# Altium schematic sheet Buck_Converter.SchDoc
size B; SheetNumber: 4; SheetTotal: 4
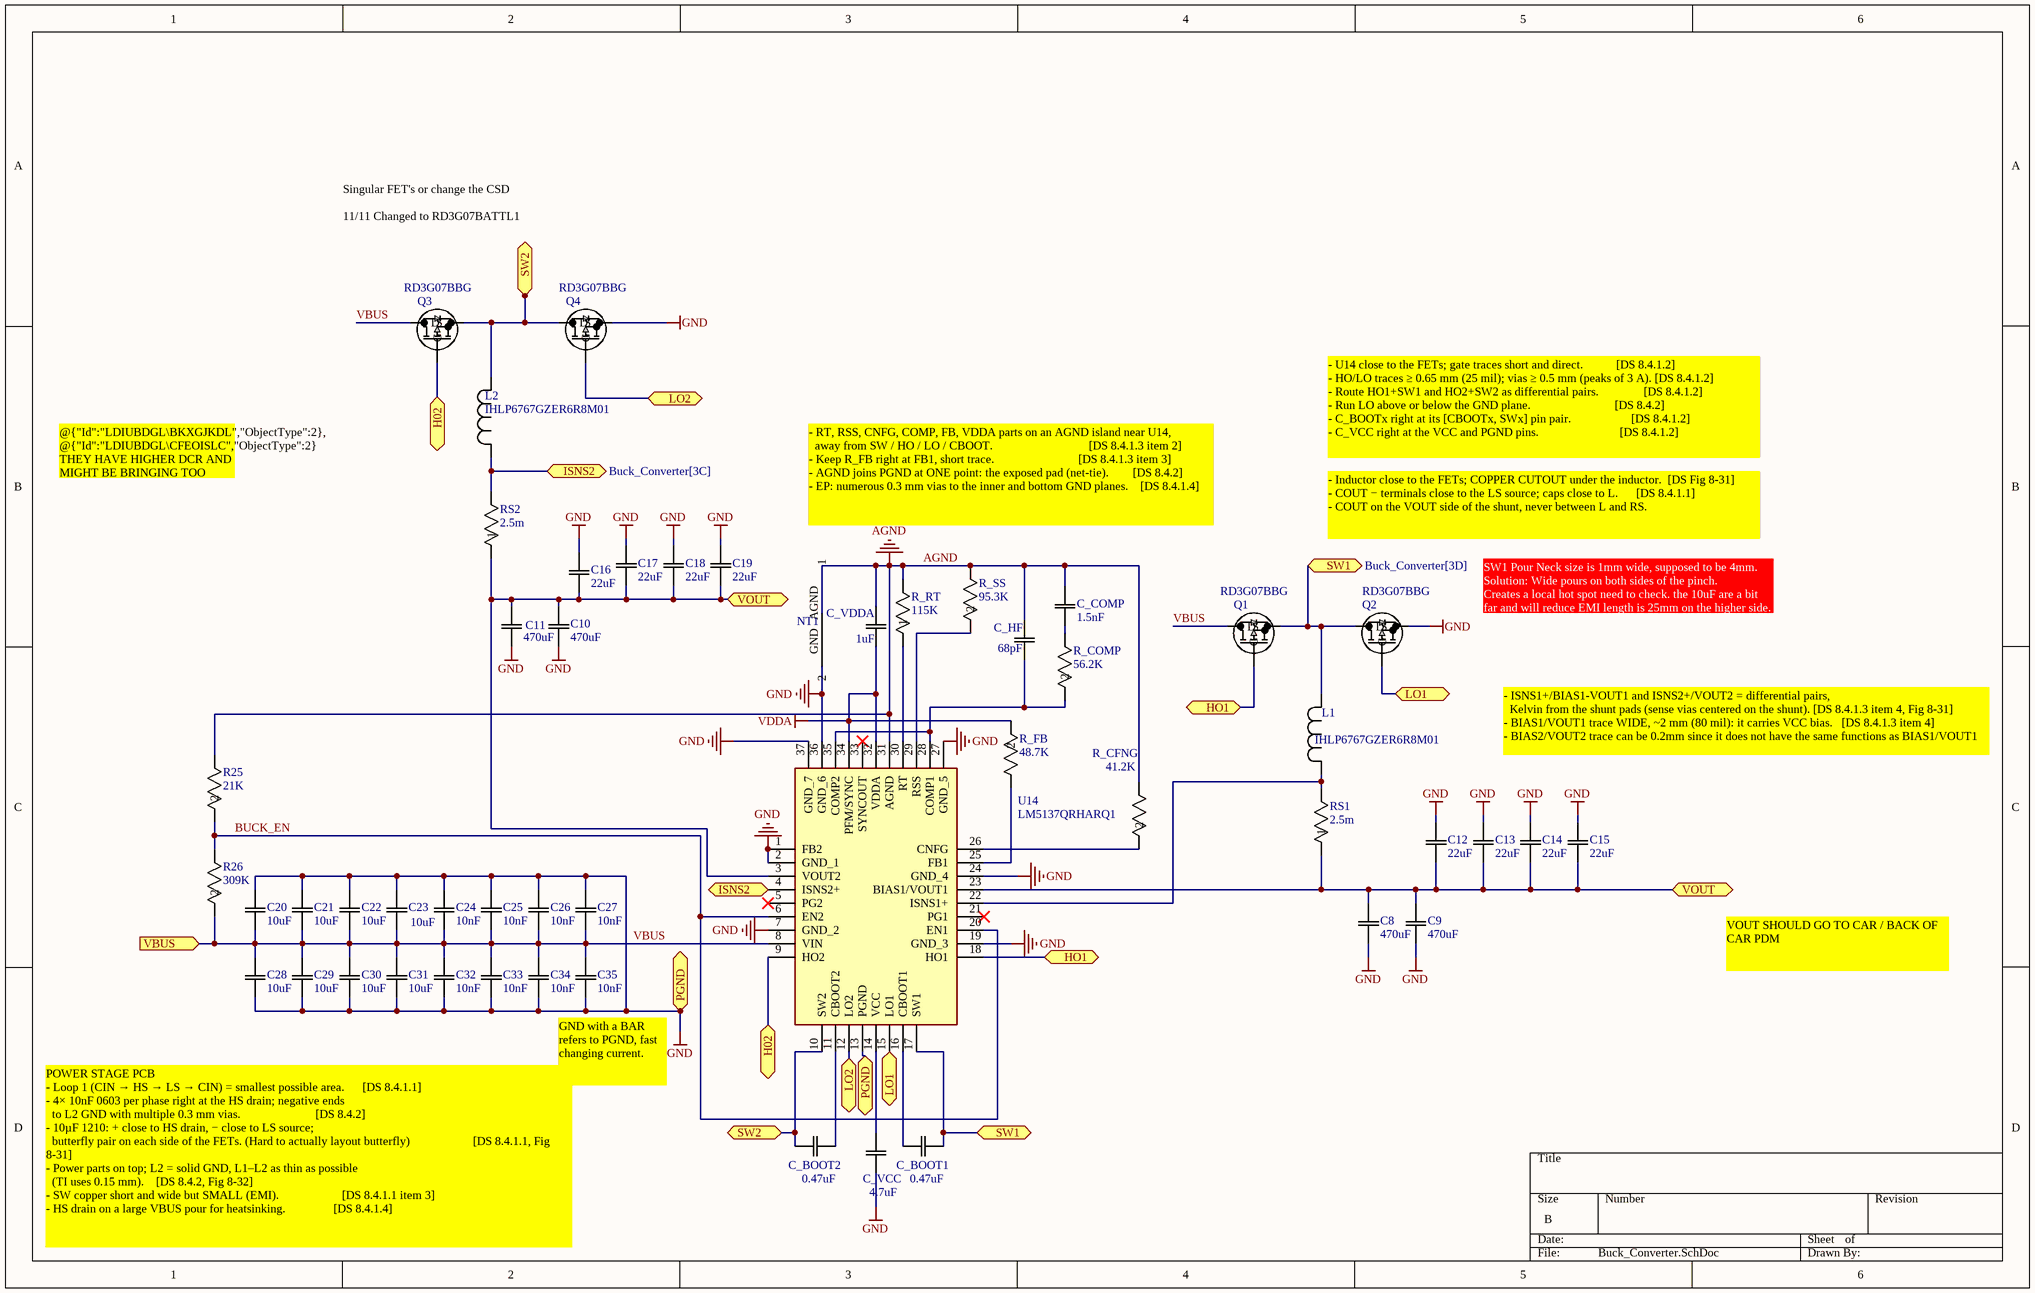
[diagram p0: Buck_Converter.SchDoc]

## Parts
C8  470uF  [CAP_EEHZ-G16_PAN]
C9  470uF  [CAP_EEHZ-G16_PAN]
C10  470uF  [CAP_EEHZ-G16_PAN]
C11  470uF  [CAP_EEHZ-G16_PAN]
C12  22uF  [CAP_CGA6_TDK]
C13  22uF  [CAP_CGA6_TDK]
C14  22uF  [CAP_CGA6_TDK]
C15  22uF  [CAP_CGA6_TDK]
C16  22uF  [CAP_CGA6_TDK]
C17  22uF  [CAP_CGA6_TDK]
C18  22uF  [CAP_CGA6_TDK]
C19  22uF  [CAP_CGA6_TDK]
C20  10uF  [CAP_CL32_SAM]
C21  10uF  [CAP_CL32_SAM]
C22  10uF  [CAP_CL32_SAM]
C23  10uF  [CAP_CL32_SAM]
C24  10nF  [G-155_MUR]
C25  10nF  [G-155_MUR]
C26  10nF  [G-155_MUR]
C27  10nF  [G-155_MUR]
C28  10uF  [CAP_CL32_SAM]
C29  10uF  [CAP_CL32_SAM]
C30  10uF  [CAP_CL32_SAM]
C31  10uF  [CAP_CL32_SAM]
C32  10nF  [G-155_MUR]
C33  10nF  [G-155_MUR]
C34  10nF  [G-155_MUR]
C35  10nF  [G-155_MUR]
C_BOOT1  0.47uF  [CAP_CL10_SAM]
C_BOOT2  0.47uF  [CAP_CL10_SAM]
C_COMP  1.5nF  [G-188_MUR]
C_HF  68pF  [CAP_CL10_SAM]
C_VCC  4.7uF  [CAP_TMK212AB7475KG-T_TAY]
C_VDDA  1uF  [CAPC17595_90N_KEM]
L1  IHLP6767GZER6R8M01  [IND_IHLP-6767GZ_VIS]
L2  IHLP6767GZER6R8M01  [IND_IHLP-6767GZ_VIS]
NT1  (no value)  [NetTie]  (net tie, no BOM)
Q1  RD3G07BBG  [DPAK_TO-252_ROM]
Q2  RD3G07BBG  [DPAK_TO-252_ROM]
Q3  RD3G07BBG  [DPAK_TO-252_ROM]
Q4  RD3G07BBG  [DPAK_TO-252_ROM]
R25  21K  [RC0603N_YAG]
R26  309K  [RC0603N_PAN]
R_CFNG  41.2K  [RC0603N_PAN]
R_COMP  56.2K  [RES_CRCW_0603]
R_FB  48.7K  [RES_CRCW_0603]
R_RT  115K  [RES_RMCF0603_STP]
R_SS  95.3K  [RC0603N_PAN]
RS1  2.5m  [RES_WSLP3921_.002OHM_VIS]
RS2  2.5m  [RES_WSLP3921_.002OHM_VIS]
U14  LM5137QRHARQ1  [LM5137QRHARQ1]

## Ports
H02 (bidir, see Buck_Converter[2B]), H02 (bidir, see Buck_Converter[3D]), HO1 (bidir, see Buck_Converter[4C]), ISNS2 (bidir, see Buck_Converter[2B]), ISNS2 (bidir, see Buck_Converter[3C]), LO1 (bidir, see Buck_Converter[3D]), LO1 (bidir, see Buck_Converter[5C]), LO2 (bidir, see Buck_Converter[2B]), LO2 (bidir, see Buck_Converter[3D]), PGND (bidir, see Buck_Converter[3D]), SW1 (bidir, see Buck_Converter[3D]), SW1 (bidir, see Buck_Converter[4B]), SW2 (bidir, see Buck_Converter[2A]), SW2 (bidir, see Buck_Converter[3D]), VBUS (in, see Battery_Logic[4C], FET_PowerPath[5A], FET_PowerPath[5B], FET_PowerPath[5C]), VOUT (bidir, see Buck_Converter[3B]), VOUT (bidir, see Buck_Converter[5C])

## Nets
AGND: C_COMP.2 C_HF.2 C_VDDA.2 NT1.AGND(1) R25.1 R_CFNG.1 R_RT.2 R_SS.1 U14.31(AGND)
GND: C8.1 C9.1 C10.2 C11.2 C12.1 C13.1 C14.1 C15.1 C16.1 C17.1 C18.1 C19.1 C20.1 C21.1 C22.1 C23.1 C24.2 C25.2 C26.2 C27.2 C28.2 C29.2 C30.2 C31.2 C32.1 C33.1 C34.1 C35.1 C_VCC.1 Q2.3(S) Q4.3(S) U14.1(FB2) U14.2(GND_1) U14.7(GND_2) U14.13(PGND) U14.19(GND_3) U14.24(GND_4) U14.27(GND_5) U14.36(GND_6) U14.37(GND_7) ; port PGND
VDDA: C_VDDA.1 R_FB.2 U14.32(VDDA) U14.34(PFM/SYNC)
BUCK_EN: R25.2 R26.1 U14.6(EN2) U14.20(EN1)
H02: Q3.1(G) U14.9(HO2) ; port H02
HO1: Q1.1(G) U14.18(HO1) ; port HO1
ISNS2: L2.2 RS2.2 U14.4(ISNS2+) ; port ISNS2
LO1: Q2.1(G) U14.15(LO1) ; port LO1
LO2: Q4.1(G) U14.12(LO2) ; port LO2
SW1: C_BOOT1.2 L1.1 Q1.3(S) Q2.2(D) U14.17(SW1) ; port SW1
SW2: C_BOOT2.2 L2.1 Q3.3(S) Q4.2(D) U14.10(SW2) ; port SW2
VBUS: C20.2 C21.2 C22.2 C23.2 C24.1 C25.1 C26.1 C27.1 C28.1 C29.1 C30.1 C31.1 C32.2 C33.2 C34.2 C35.2 Q1.2(D) Q3.2(D) R26.2 U14.8(VIN) ; port VBUS
VOUT: C8.2 C9.2 C10.1 C11.1 C12.2 C13.2 C14.2 C15.2 C16.2 C17.2 C18.2 C19.2 RS1.1 RS2.1 U14.3(VOUT2) U14.23(BIAS1/VOUT1) ; port VOUT
NetC_BOOT1_1: C_BOOT1.1 U14.16(CBOOT1)
NetC_BOOT2_1: C_BOOT2.1 U14.11(CBOOT2)
NetC_COMP_1: C_COMP.1 R_COMP.1
NetC_HF_1: C_HF.1 R_COMP.2 U14.28(COMP1) U14.35(COMP2)
NetC_VCC_2: C_VCC.2 U14.14(VCC)
NetL1_2: L1.2 RS1.2 U14.22(ISNS1+)
NetR_CFNG_2: R_CFNG.2 U14.26(CNFG)
NetR_FB_1: R_FB.1 U14.25(FB1)
NetR_RT_1: R_RT.1 U14.30(RT)
NetR_SS_2: R_SS.2 U14.29(RSS)

Not connected (* = marked no-connect by the designer): NT1 GND(2); U14 5(PG2)* 21(PG1)* 33(SYNCOUT)*

## Notes on the sheet
- Singular FET's or change the CSD
  11/11 Changed to RD3G07BATTL1
- @{"Id":"LDIUBDGL\BKXGJKDL","ObjectType":2}, @{"Id":"LDIUBDGL\CFEOISLC","ObjectType":2} THEY HAVE HIGHER DCR AND MIGHT BE BRINGING TOO MUCH HEAT INTO THE FETS
- - U14 close to the FETs; gate traces short and direct.           [DS 8.4.1.2]
  - HO/LO traces ≥ 0.65 mm (25 mil); vias ≥ 0.5 mm (peaks of 3 A). [DS 8.4.1.2]
  - Route HO1+SW1 and HO2+SW2 as differential pairs.               [DS 8.4.1.2]
  - Run LO above or below the GND plane.                            [DS 8.4.2]
  - C_BOOTx right at its [CBOOTx, SWx] pin pair.                    [DS 8.4.1.2]
  - C_VCC right at the VCC and PGND pins.                           [DS 8.4.1.2]
- - RT, RSS, CNFG, COMP, FB, VDDA parts on an AGND island near U14,
  away from SW / HO / LO / CBOOT.                                [DS 8.4.1.3 item 2]
  - Keep R_FB right at FB1, short trace.                            [DS 8.4.1.3 item 3]
  - AGND joins PGND at ONE point: the exposed pad (net-tie).        [DS 8.4.2]
  - EP: numerous 0.3 mm vias to the inner and bottom GND planes.    [DS 8.4.1.4]
- - Inductor close to the FETs; COPPER CUTOUT under the inductor.  [DS Fig 8-31]
  - COUT − terminals close to the LS source; caps close to L.      [DS 8.4.1.1]
  - COUT on the VOUT side of the shunt, never between L and RS.
- SW1 Pour Neck size is 1mm wide, supposed to be 4mm.
  Solution: Wide pours on both sides of the pinch.
  Creates a local hot spot need to check. the 10uF are a bit far and will reduce EMI length is 25mm on the higher side.
- - ISNS1+/BIAS1-VOUT1 and ISNS2+/VOUT2 = differential pairs,
  Kelvin from the shunt pads (sense vias centered on the shunt). [DS 8.4.1.3 item 4, Fig 8-31]
  - BIAS1/VOUT1 trace WIDE, ~2 mm (80 mil): it carries VCC bias.   [DS 8.4.1.3 item 4]
  - BIAS2/VOUT2 trace can be 0.2mm since it does not have the same functions as BIAS1/VOUT1
- VOUT SHOULD GO TO CAR / BACK OF CAR PDM
- GND with a BAR refers to PGND, fast changing current.
- POWER STAGE PCB
  - Loop 1 (CIN → HS → LS → CIN) = smallest possible area.      [DS 8.4.1.1]
  - 4× 10nF 0603 per phase right at the HS drain; negative ends
  to L2 GND with multiple 0.3 mm vias.                         [DS 8.4.2]
  - 10µF 1210: + close to HS drain, − close to LS source;
  butterfly pair on each side of the FETs. (Hard to actually layout butterfly)                     [DS 8.4.1.1, Fig 8-31]
  - Power parts on top; L2 = solid GND, L1–L2 as thin as possible
  (TI uses 0.15 mm).    [DS 8.4.2, Fig 8-32]
  - SW copper short and wide but SMALL (EMI).                     [DS 8.4.1.1 item 3]
  - HS drain on a large VBUS pour for heatsinking.                [DS 8.4.1.4]

## Library data of the parts
C8-C11 = EEHZU1V471V: Description; Manufacturer_Name: Panasonic; Copyright: Copyright (C) 2025 Ultra Librarian. All rights reserved.; Manufacturer_Part_Number: EEHZU1V471V
C12-C19 = CGA6P3X7R1E226M250AB: Description; Manufacturer_Name: TDK; Copyright: Copyright (C) 2025 Ultra Librarian. All rights reserved.; Manufacturer_Part_Number: CGA6P3X7R1E226M250AB
C20-C23 C28-C31 = CL32B106KBJNNNE: Description; Manufacturer_Name: Samsung; Copyright: Copyright (C) 2025 Ultra Librarian. All rights reserved.; Manufacturer_Part_Number: CL32B106KBJNNNE
C24-C27 C32-C35 = GCM155R71H103KA55D: Description; Manufacturer_Name: Murata; Copyright: Copyright (C) 2025 Ultra Librarian. All rights reserved.; Manufacturer_Part_Number: GCM155R71H103KA55D
C_BOOT1 C_BOOT2 = CL10B474KA8NFNC: Description; Manufacturer_Name: Samsung; Copyright: Copyright (C) 2026 Ultra Librarian. All rights reserved.; Manufacturer_Part_Number: CL10B474KA8NFNC
C_COMP = GRM1885C1H152JA01D: Description; Manufacturer_Name: Murata; Copyright: Copyright (C) 2025 Ultra Librarian. All rights reserved.; Manufacturer_Part_Number: GRM1885C1H152JA01D
C_HF = CL10C680JB8NNNC: No Description Available; Manufacturer_Name: Samsung; Copyright: Copyright (C) 2026 Ultra Librarian. All rights reserved.; Manufacturer_Part_Number: CL10C680JB8NNNC
C_VCC = TMK212AB7475KG-T: Description; Manufacturer_Name: Taiyo Yuden; Copyright: Copyright (C) 2025 Ultra Librarian. All rights reserved.; Manufacturer_Part_Number: TMK212AB7475KG-T
C_VDDA = C0603C105K4RACTU: SMD Comm X7R, Ceramic, 1 uF, 10%, 16 VDC, X7R, SMD, MLCC, Temperature Stable, Class II, 0603; Manufacturer_Name: Kemet; Copyright: Copyright (C) 2026 Ultra Librarian. All rights reserved.; Manufacturer_Part_Number: C0603C105K4RACTU
L1 L2 = IHLP6767GZER6R8M01: IHLP-6767GZ-01 6.8 20% ER E3; Manufacturer_Name: Vishay; Copyright: Copyright (C) 2025 Ultra Librarian. All rights reserved.; Manufacturer_Part_Number: IHLP6767GZER6R8M01
NT1 = NetTie: Net Tie for AGND and GND; pin to pad: AGND>1 GND>2
Q1-Q4 = RD3G07BATTL1: N-Channel; Manufacturer_Name: ROHM Semiconductor; Type: Transistors; Copyright: Copyright (C) 2026 Ultra Librarian. All rights reserved.; Manufacturer_Part_Number: RD3G07BATTL1
R25 = RC0603FR-0721KL: No Description Available; Manufacturer_Name: Yageo; Copyright: Copyright (C) 2026 Ultra Librarian. All rights reserved.; Manufacturer_Part_Number: RC0603FR-0721KL
R26 = ERJ-3EKF3093V: No Description Available; Manufacturer_Name: Panasonic; Copyright: Copyright (C) 2026 Ultra Librarian. All rights reserved.; Manufacturer_Part_Number: ERJ-3EKF3093V
R_CFNG = ERJ-3EKF4122V: Description; Manufacturer_Name: Panasonic; Copyright: Copyright (C) 2025 Ultra Librarian. All rights reserved.; Manufacturer_Part_Number: ERJ-3EKF4122V
R_COMP = CRCW060356K2FKEA: No Description Available; Manufacturer_Name: Vishay; Copyright: Copyright (C) 2026 Ultra Librarian. All rights reserved.; Manufacturer_Part_Number: CRCW060356K2FKEA; Datasheet: https://www.vishay.com/doc?20035
R_FB = CRCW060348K7FKEA: No Description Available; Manufacturer_Name: Vishay; Copyright: Copyright (C) 2026 Ultra Librarian. All rights reserved.; Manufacturer_Part_Number: CRCW060348K7FKEA; Datasheet: https://www.vishay.com/doc?20035
R_RT = RMCF0603FT115K: No Description Available; Manufacturer_Name: Stackpole International; Copyright: Copyright (C) 2026 Ultra Librarian. All rights reserved.; Manufacturer_Part_Number: RMCF0603FT115K
R_SS = ERJ-3EKF9532V: Description; Manufacturer_Name: Panasonic; Copyright: Copyright (C) 2026 Ultra Librarian. All rights reserved.; Manufacturer_Part_Number: ERJ-3EKF9532V
RS1 RS2 = WSLP39212L500FEA: WSLP3921 .0025 1% EA; Manufacturer_Name: Vishay; Copyright: Copyright (C) 2025 Ultra Librarian. All rights reserved.; Manufacturer_Part_Number: WSLP39212L500FEA
U14 = LM5137QRHARQ1: Switching Controllers Automotive, 80V, 100% duty-cycle capable dual-channel synchronous buck controller; Manufacturer_Name: Texas Instruments; Geometry.Height: 1mm; Mouser Part Number: *; Mouser Price/Stock: *; Manufacturer_Part_Number: LM5137QRHARQ1; Datasheet Link: https://www.ti.com/lit/ds/symlink/lm5137-q1.pdf?ts=1761300127638&ref_url=https%253A%252F%252Fwww.ti.com%252Fproduct%252FLM5137-Q1%252Fpart-details%252FLM5137QRHARQ1